# Altium project Ezlo_Voice_AssistantHUB.PrjPcb (part 6 of 10)

## Sheet Internal_Power_Sheet.SchDoc
size A4; DocumentNumber: 7; SheetNumber: 7; SheetTotal: 27
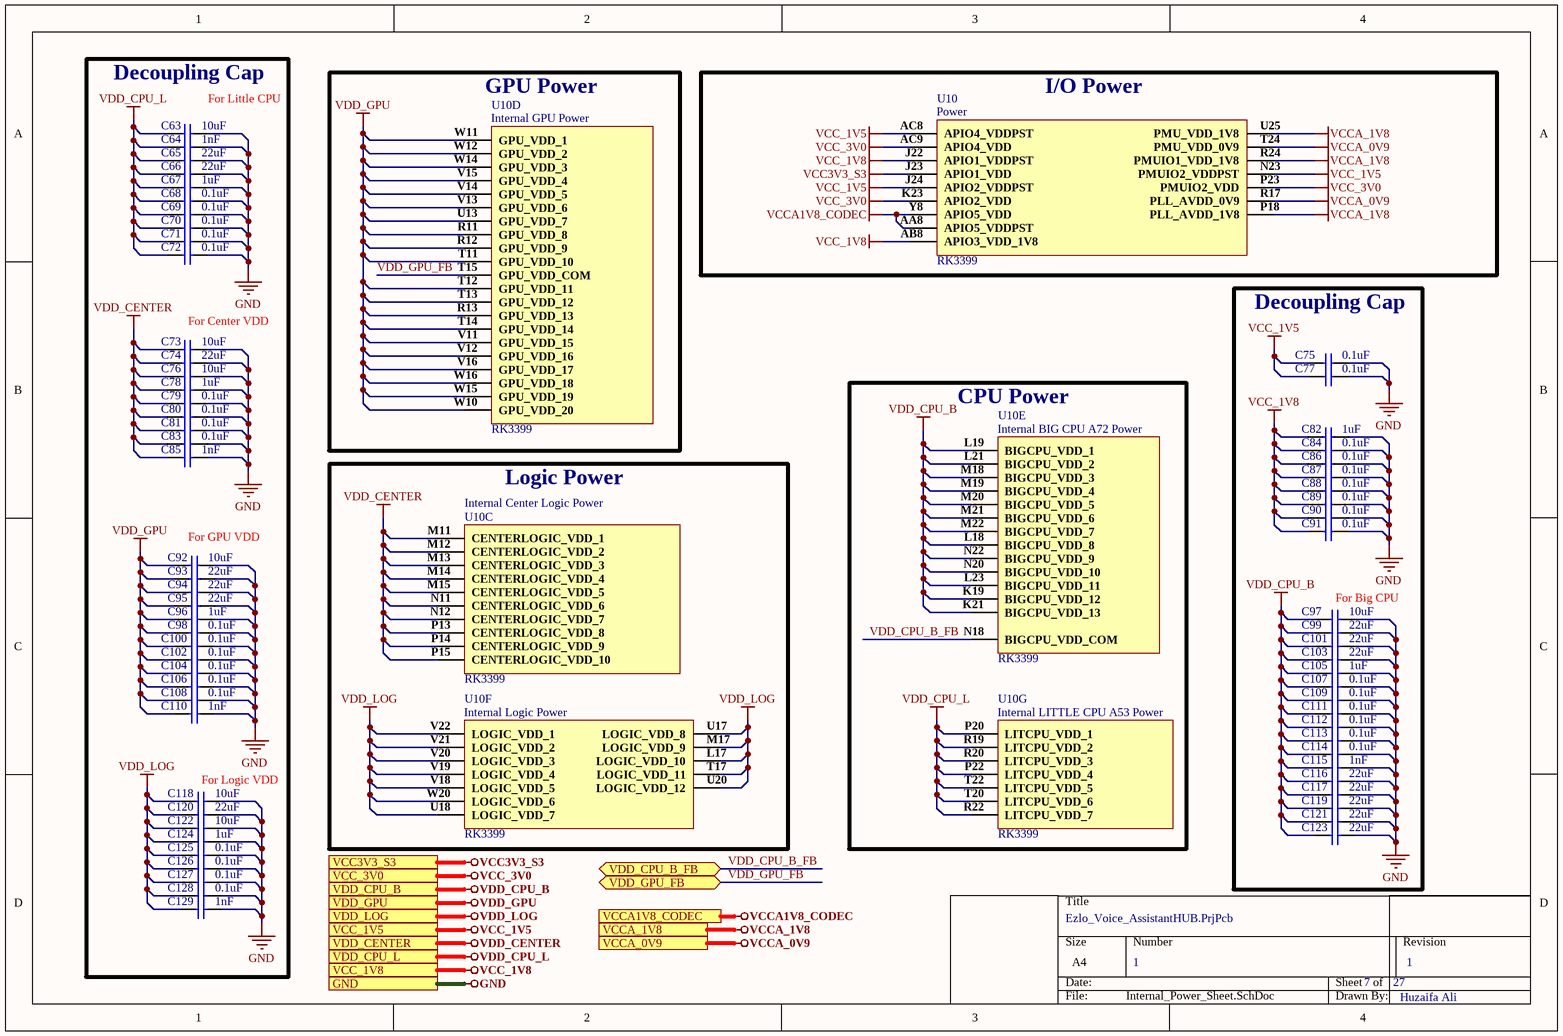
[diagram p9: Internal_Power_Sheet.SchDoc]

### Parts
C63  10uF  [Cap0603]
C64  1nF  [Cap0603]
C65  22uF  [Cap0805]
C66  22uF  [Cap0805]
C67  1uF  [Cap0402]
C68  0.1uF  [Cap0402]
C69  0.1uF  [Cap0402]
C70  0.1uF  [Cap0402]
C71  0.1uF  [Cap0402]
C72  0.1uF  [Cap0402]
C73  10uF  [Cap0603]
C74  22uF  [Cap0805]
C75  0.1uF  [Cap0402]
C76  10uF  [Cap0603]
C77  0.1uF  [Cap0402]
C78  1uF  [Cap0402]
C79  0.1uF  [Cap0402]
C80  0.1uF  [Cap0402]
C81  0.1uF  [Cap0402]
C82  1uF  [Cap0402]
C83  0.1uF  [Cap0402]
C84  0.1uF  [Cap0402]
C85  1nF  [Cap0603]
C86  0.1uF  [Cap0402]
C87  0.1uF  [Cap0402]
C88  0.1uF  [Cap0402]
C89  0.1uF  [Cap0402]
C90  0.1uF  [Cap0402]
C91  0.1uF  [Cap0402]
C92  10uF  [Cap0603]
C93  22uF  [Cap0805]
C94  22uF  [Cap0805]
C95  22uF  [Cap0805]
C96  1uF  [Cap0402]
C97  10uF  [Cap0603]
C98  0.1uF  [Cap0402]
C99  22uF  [Cap0805]
C100  0.1uF  [Cap0402]
C101  22uF  [Cap0805]
C102  0.1uF  [Cap0402]
C103  22uF  [Cap0805]
C104  0.1uF  [Cap0402]
C105  1uF  [Cap0402]
C106  0.1uF  [Cap0402]
C107  0.1uF  [Cap0402]
C108  0.1uF  [Cap0402]
C109  0.1uF  [Cap0402]
C110  1nF  [Cap0603]
C111  0.1uF  [Cap0402]
C112  0.1uF  [Cap 0402]
C113  0.1uF  [Cap0402]
C114  0.1uF  [Cap0402]
C115  1nF  [Cap0603]
C116  22uF  [Cap0805]
C117  22uF  [Cap0805]
C118  10uF  [Cap0603]
C119  22uF  [Cap0805]
C120  22uF  [Cap0805]
C121  22uF  [Cap0805]
C122  10uF  [Cap0603]
C123  22uF  [Cap0805]
C124  1uF  [Cap0402]
C125  0.1uF  [Cap0402]
C126  0.1uF  [Cap0402]
C127  0.1uF  [Cap0402]
C128  0.1uF  [Cap0402]
C129  1nF  [Cap0603]
U10  RK3399  [RK3399]  (parts C,D,E,F,G,29 of 34)

### Blocks framed on the sheet
Decoupling Cap: C63-C74 C76 C78-C81 C83 C85 C92-C96 C98 C100 C102 C104 C106 C108 C110 C118 C120 C122 C124-C129
GPU Power: U10
I/O Power: U10
Decoupling Cap: C75 C77 C82 C84 C86-C91 C97 C99 C101 C103 C105 C107 C109 C111-C117 C119 C121 C123
CPU Power: U10
Logic Power: U10

### Ports
GND, VCC3V3_S3, VCC_1V5, VCC_1V8, VCC_3V0, VCCA1V8_CODEC, VCCA_0V9, VCCA_1V8, VDD_CENTER, VDD_CPU_B, VDD_CPU_B_FB (bidir), VDD_CPU_L, VDD_GPU, VDD_GPU_FB (bidir), VDD_LOG

### Nets
GND: C63.2 C64.2 C65.2 C66.2 C67.2 C68.2 C69.2 C70.2 C71.2 C72.2 C73.2 C74.2 C75.2 C76.2 C77.2 C78.2 C79.2 C80.2 C81.2 C82.2 C83.2 C84.2 C85.2 C86.2 C87.2 C88.2 C89.2 C90.2 C91.2 C92.2 C93.2 C94.2 C95.2 C96.2 C97.2 C98.2 C99.2 C100.2 C101.2 C102.2 C103.2 C104.2 C105.2 C106.2 C107.2 C108.2 C109.2 C110.2 C111.2 C112.2 C113.2 C114.2 C115.2 C116.2 C117.2 C118.2 C119.2 C120.2 C121.2 C122.2 C123.2 C124.2 C125.2 C126.2 C127.2 C128.2 C129.2 ; port GND
VCC3V3_S3: U10.J23(APIO1_VDD) ; port VCC3V3_S3
VCC_1V5: C75.1 C77.1 U10.AC8(APIO4_VDDPST) U10.J24(APIO2_VDDPST) U10.N23(PMUIO2_VDDPST) ; port VCC_1V5
VCC_1V8: C82.1 C84.1 C86.1 C87.1 C88.1 C89.1 C90.1 C91.1 U10.AB8(APIO3_VDD_1V8) U10.J22(APIO1_VDDPST) ; port VCC_1V8
VCC_3V0: U10.AC9(APIO4_VDD) U10.K23(APIO2_VDD) U10.P23(PMUIO2_VDD) ; port VCC_3V0
VCCA1V8_CODEC: U10.AA8(APIO5_VDDPST) U10.Y8(APIO5_VDD) ; port VCCA1V8_CODEC
VCCA_0V9: U10.R17(PLL_AVDD_0V9) U10.T24(PMU_VDD_0V9) ; port VCCA_0V9
VCCA_1V8: U10.P18(PLL_AVDD_1V8) U10.R24(PMUIO1_VDD_1V8) U10.U25(PMU_VDD_1V8) ; port VCCA_1V8
VDD_CENTER: C73.1 C74.1 C76.1 C78.1 C79.1 C80.1 C81.1 C83.1 C85.1 U10.M11(CENTERLOGIC_VDD_1) U10.M12(CENTERLOGIC_VDD_2) U10.M13(CENTERLOGIC_VDD_3) U10.M14(CENTERLOGIC_VDD_4) U10.M15(CENTERLOGIC_VDD_5) U10.N11(CENTERLOGIC_VDD_6) U10.N12(CENTERLOGIC_VDD_7) U10.P13(CENTERLOGIC_VDD_8) U10.P14(CENTERLOGIC_VDD_9) U10.P15(CENTERLOGIC_VDD_10) ; port VDD_CENTER
VDD_CPU_B: C97.1 C99.1 C101.1 C103.1 C105.1 C107.1 C109.1 C111.1 C112.1 C113.1 C114.1 C115.1 C116.1 C117.1 C119.1 C121.1 C123.1 U10.K19(BIGCPU_VDD_12) U10.K21(BIGCPU_VDD_13) U10.L18(BIGCPU_VDD_8) U10.L19(BIGCPU_VDD_1) U10.L21(BIGCPU_VDD_2) U10.L23(BIGCPU_VDD_11) U10.M18(BIGCPU_VDD_3) U10.M19(BIGCPU_VDD_4) U10.M20(BIGCPU_VDD_5) U10.M21(BIGCPU_VDD_6) U10.M22(BIGCPU_VDD_7) U10.N20(BIGCPU_VDD_10) U10.N22(BIGCPU_VDD_9) ; port VDD_CPU_B
VDD_CPU_L: C63.1 C64.1 C65.1 C66.1 C67.1 C68.1 C69.1 C70.1 C71.1 C72.1 U10.P20(LITCPU_VDD_1) U10.P22(LITCPU_VDD_4) U10.R19(LITCPU_VDD_2) U10.R20(LITCPU_VDD_3) U10.R22(LITCPU_VDD_7) U10.T20(LITCPU_VDD_6) U10.T22(LITCPU_VDD_5) ; port VDD_CPU_L
VDD_GPU: C92.1 C93.1 C94.1 C95.1 C96.1 C98.1 C100.1 C102.1 C104.1 C106.1 C108.1 C110.1 U10.R11(GPU_VDD_8) U10.R12(GPU_VDD_9) U10.R13(GPU_VDD_13) U10.T11(GPU_VDD_10) U10.T12(GPU_VDD_11) U10.T13(GPU_VDD_12) U10.T14(GPU_VDD_14) U10.U13(GPU_VDD_7) U10.V11(GPU_VDD_15) U10.V12(GPU_VDD_16) U10.V13(GPU_VDD_6) U10.V14(GPU_VDD_5) U10.V15(GPU_VDD_4) U10.V16(GPU_VDD_17) U10.W10(GPU_VDD_20) U10.W11(GPU_VDD_1) U10.W12(GPU_VDD_2) U10.W14(GPU_VDD_3) U10.W15(GPU_VDD_19) U10.W16(GPU_VDD_18) ; port VDD_GPU
VDD_LOG: C118.1 C120.1 C122.1 C124.1 C125.1 C126.1 C127.1 C128.1 C129.1 U10.L17(LOGIC_VDD_10) U10.M17(LOGIC_VDD_9) U10.T17(LOGIC_VDD_11) U10.U17(LOGIC_VDD_8) U10.U18(LOGIC_VDD_7) U10.U20(LOGIC_VDD_12) U10.V18(LOGIC_VDD_5) U10.V19(LOGIC_VDD_4) U10.V20(LOGIC_VDD_3) U10.V21(LOGIC_VDD_2) U10.V22(LOGIC_VDD_1) U10.W20(LOGIC_VDD_6) ; port VDD_LOG
VDD_CPU_B_FB: U10.N18(BIGCPU_VDD_COM) ; port VDD_CPU_B_FB
VDD_GPU_FB: U10.T15(GPU_VDD_COM) ; port VDD_GPU_FB

### Notes on the sheet
- For Little CPU
- Text
- For Center VDD
- For GPU VDD
- (near C97) For Big CPU
- (near C118) For Logic VDD
- 1
- Huzaifa Ali
- (in symbol RK3399, part C) Internal Center Logic Power
- (in symbol RK3399, part D) Internal GPU Power
- (in symbol RK3399, part E) Internal BIG CPU A72 Power
- (in symbol RK3399, part F) Internal Logic Power
- (in symbol RK3399, part G) Internal LITTLE CPU A53 Power
- (in symbol RK3399, part 29) Power

### Library data of the parts
C63 C73 C76 C92 C97 C118 C122 = C1608X5R1E106M080AC: CAP CER 10UF 25V X5R 0603; Manufacturer: TDK; Dielectric Material: Ceramic; Tolerance: 20%; Supplier 1: Digi-Key; Manufacturer Part Number: C1608X5R1E106M080AC; Stock 1: 61681; Pricing 1: 1=0.96, 10=0.704, 100=0.483, 500=0.38238, 1000=0.322 (USD); Mount: Surface Mount; Case/Package: 0603; Weight: 7.1E-05oz; Case Code (Imperial): 0603; Case Code (Metric): 1608; Min Operating Temperature: -55°C; Max Operating Temperature: 85°C; Capacitance: 10uF; Packaging: Tape and Reel; Voltage Rating: 25V; Voltage Rating (DC): 25V; Termination: SMD/SMT; Package Quantity: 1; Dielectric: X5R; Composition: Ceramic; Length: 1.6mm; Height: 0.8mm; Width: 0.8mm; Thickness: 0.039inch; Depth: 0.8mm; Lead Free: Lead Free; REACH SVHC: No SVHC; Supplier Part Number 1: 445-9015-1-ND
C64 C85 C110 C115 C129 = CC0603KRX7R8BB102: CAP CER 0603 1nF 25 V ±10 % Tolerance X7R SMT; Manufacturer: Yageo; Tolerance: 10%; Voltage Rating: 25V; Supplier 1: Arrow Electronics; Manufacturer Part Number: CC0603KRX7R8BB102; RoHS: Yes; Category: Ceramic Capacitors; Stock 1: 974; Pricing 1: 1=0.07500, 10=0.04120, 25=0.04030, 100=0.02020, 250=0.02000, 500=0.01320 (USD); Mount: Surface Mount; Case/Package: 0603; Case Code (Imperial): 0603; Case Code (Metric): 1608; Weight: 7.1E-05oz; Min Operating Temperature: -55°C; Max Operating Temperature: 125°C; Capacitance: 1nF; Dielectric: X7R; Packaging: Tape and Reel; Voltage Rating (DC): 25V; Termination: SMD/SMT; Resistor Type: Ceramic; Series: CC; Construction: Flat; Length: 1.6mm; Width: 0.031inch; Height: 0.8mm; Thickness: 0.035inch; Depth: 0.8mm; Radiation Hardening: No; Lead Free: Lead Free; Halogen Free: Halogen Free; RoHS Compliant: Yes; ComponentLink1URL: https://datasheet.ciiva.com/13263/upy-gphc-x7r-6-3v-to-50v-8-12304-13263372.pdf?src-supplier=Mouser; ComponentLink1Description: https://datasheet.ciiva.com/13263/upy-gphc-x7r-6-3v-to-50v-8-12304-13263372.pdf?src-supplier=Mouser; Supplier Part Number 1: CC0603KRX7R8BB102
C65 C66 C74 C93-C95 C99 C101 C103 C116 C117 C119-C121 C123 = CL21A226MAYNNNE: 0803 22uF 25V X5R 20% multilayer ceramic capacitor; Manufacturer: Samsung; Supplier 1: Digi-Key; Manufacturer Part Number: CL21A226MAYNNNE; RoHS: Yes; Category: Ceramic Capacitors; Stock 1: 442950; Pricing 1: 2000=0.07687, 4000=0.07110, 10000=0.06726, 14000=0.06380, 50000=0.05765 (USD); RoHS Compliant: Yes; Supplier Part Number 1: 1276-CL21A226MAYNNNETR-ND
C67 C78 C82 C96 C105 C124 = GRM155R61E105KA12D: CAP CER 1UF 25V X5R 0402; Manufacturer: Murata; Material: Ceramic; Tolerance: 10%; Supplier 1: Digi-Key; Manufacturer Part Number: GRM155R61E105KA12D; Stock 1: 1194305; Pricing 1: 1=0.11, 10=0.077, 100=0.0363, 500=0.02546, 1000=0.02108, 2500=0.01962, 5000=0.01795 (USD); Mount: Surface Mount; Case/Package: 0402; Weight: 0.000212oz; Case Code (Metric): 1005; Case Code (Imperial): 0402; Min Operating Temperature: -55°C; Max Operating Temperature: 85°C; Capacitance: 1uF; Voltage Rating: 25V; Packaging: Tape and Reel; Dielectric: X5R; Voltage: 25V; Termination: SMD/SMT; Voltage Rating (DC): 25V; Package Quantity: 10000; Length: 1mm; Height: 0.5mm; Width: 0.5mm; Thickness: 0.022inch; Depth: 0.5mm; REACH SVHC: No SVHC; Lead Free: Lead Free; ComponentLink1URL: http://www.farnell.com/datasheets/2048341.pdf?src-supplier=Element14; ComponentLink1Description: http://www.farnell.com/datasheets/2048341.pdf?src-supplier=Element14; Supplier Part Number 1: 490-10017-1-ND
C68-C72 C75 C77 C79-C81 C83 C84 C86-C91 C98 C100 C102 C104 C106-C109 C111 C113 C114 C125-C128 = CC0402KRX5R6BB104: CAP CER 0.1UF 10V X5R 0402; Manufacturer: Yageo; Capacitance: 100nF; Tolerance: 10%; Dissipation Factor: 5%; Insulation Resistance: 10GR; Supplier 1: Digi-Key; Manufacturer Part Number: CC0402KRX5R6BB104; RoHS: Yes; Category: Ceramic Capacitors; Stock 1: 6385580; Pricing 1: 1=0.10000, 10=0.02700, 50=0.01500, 100=0.01220, 500=0.00874, 1000=0.00687, 2500=0.00625, 5000=0.00575 (USD); Mount: Surface Mount; Case/Package: 0402; Number of Pins: 2; Case Code (Imperial): 0402; Case Code (Metric): 1005; Min Operating Temperature: -55°C; Max Operating Temperature: 85°C; Dielectric: X5R; Packaging: Tape and Reel; Voltage Rating: 10V; Package Quantity: 1; Termination: SMD/SMT; Voltage Rating (DC): 10V; Series: CC; Length: 1mm; Width: 0.02inch; Height: 0.5mm; Depth: 0.5mm; Thickness: 0.022inch; Radiation Hardening: No; RoHS Compliant: Yes; REACH SVHC: No SVHC; Lead Free: Lead Free; Halogen Free: Halogen Free; ComponentLink1URL: https://datasheet.ciiva.com/144/mlccorderingcode-144029.pdf?src-supplier=Digi-Key; ComponentLink1Description: https://datasheet.ciiva.com/144/mlccorderingcode-144029.pdf?src-supplier=Digi-Key; ComponentLink2URL: https://datasheet.ciiva.com/144/mlccorderingcode-144028.pdf?src-supplier=Digi-Key; ComponentLink2Description: https://datasheet.ciiva.com/144/mlccorderingcode-144028.pdf?src-supplier=Digi-Key; ComponentLink3URL: https://datasheet.ciiva.com/144/mlccorderingcode-144030.pdf?src-supplier=Digi-Key; ComponentLink3Description: https://datasheet.ciiva.com/144/mlccorderingcode-144030.pdf?src-supplier=Digi-Key; ComponentLink4URL: https://datasheet.ciiva.com/7978/1359354-7978091.pdf?src-supplier=Element14; ComponentLink4Description: https://datasheet.ciiva.com/7978/1359354-7978091.pdf?src-supplier=Element14; ComponentLink5URL: https://datasheet.ciiva.com/11587/upy-gphc-x5r-4v-to-50v-12-11587302.pdf?src-supplier=Avnet; ComponentLink5Description: https://datasheet.ciiva.com/11587/upy-gphc-x5r-4v-to-50v-12-11587302.pdf?src-supplier=Avnet; Supplier Part Number 1: 311-1336-1-ND
C112 = GRM155R71H104ME14D: CAP CER 0.1UF 50V X7R 0402; Manufacturer: Murata; Tolerance: 20%; Capacitance: 100nF; Supplier 1: Digi-Key; Manufacturer Part Number: GRM155R71H104ME14D; Stock 1: 439844; Pricing 1: 1=0.1, 10=0.038, 100=0.0168, 500=0.01198, 1000=0.00941, 2500=0.00855, 5000=0.00787 (USD); Mount: Surface Mount; Case/Package: 0402; Min Operating Temperature: -55°C; Max Operating Temperature: 125°C; Packaging: Cut Tape; Voltage Rating: 50V; Length: 0.039inch; Width: 0.02inch; Thickness: 0.022inch; ComponentLink1URL: http://search.murata.co.jp/Ceramy/image/img/A01X/G101/ENG/GRM155R71H104ME14-01.pdf?src-supplier=Digi-Key; ComponentLink1Description: http://search.murata.co.jp/Ceramy/image/img/A01X/G101/ENG/GRM155R71H104ME14-01.pdf?src-supplier=Digi-Key; ComponentLink2URL: http://psearch.en.murata.com/capacitor/product/GRM155R71H104ME14%23.pdf?src-supplier=Avnet; ComponentLink2Description: http://psearch.en.murata.com/capacitor/product/GRM155R71H104ME14%23.pdf?src-supplier=Avnet; ComponentLink3URL: http://components.arrow.com/part/dataview/0323_07177683?src-supplier=Arrow+Europe; ComponentLink3Description: http://components.arrow.com/part/dataview/0323_07177683?src-supplier=Arrow+Europe; ComponentLink4URL: http://www.mouser.com/ds/2/281/c02e-2905.pdf?src-supplier=Mouser; ComponentLink4Description: http://www.mouser.com/ds/2/281/c02e-2905.pdf?src-supplier=Mouser; Supplier Part Number 1: 490-10701-1-ND
U10 = RK3399: RK3399 CPU BGA for HD set-top box chip BGA Chipse; Manufacturer: Fuzhou Rockchip Electronics; ComponentLink1Description: Aliexpress; ComponentLink1URL: https://www.aliexpress.com/item/1005001971093459.html?spm=a2g0n.productlist.0.0.3c7csv8Qsv8Quh&browser_id=3ac7e9efb8074641aaabc4d871f09748&aff_trace_key=&aff_platform=msite&m_page_id=181389a08711fc2600d8cc522bab8d702dd4189be0&gclid=&pdp_npi=2%40dis%21USD%21%2123.6%21%21%21%21%21%402101d91e16545120399167831e8b89%21%21sea&algo_pvid=4303aedd-774c-4013-953d-920f10b55003; Manufacturer Part Number: RK3399; Footprint: FCBGA828

## Sheet GND_Sheet.SchDoc
size A4; DocumentNumber: 8; SheetNumber: 8; SheetTotal: 27
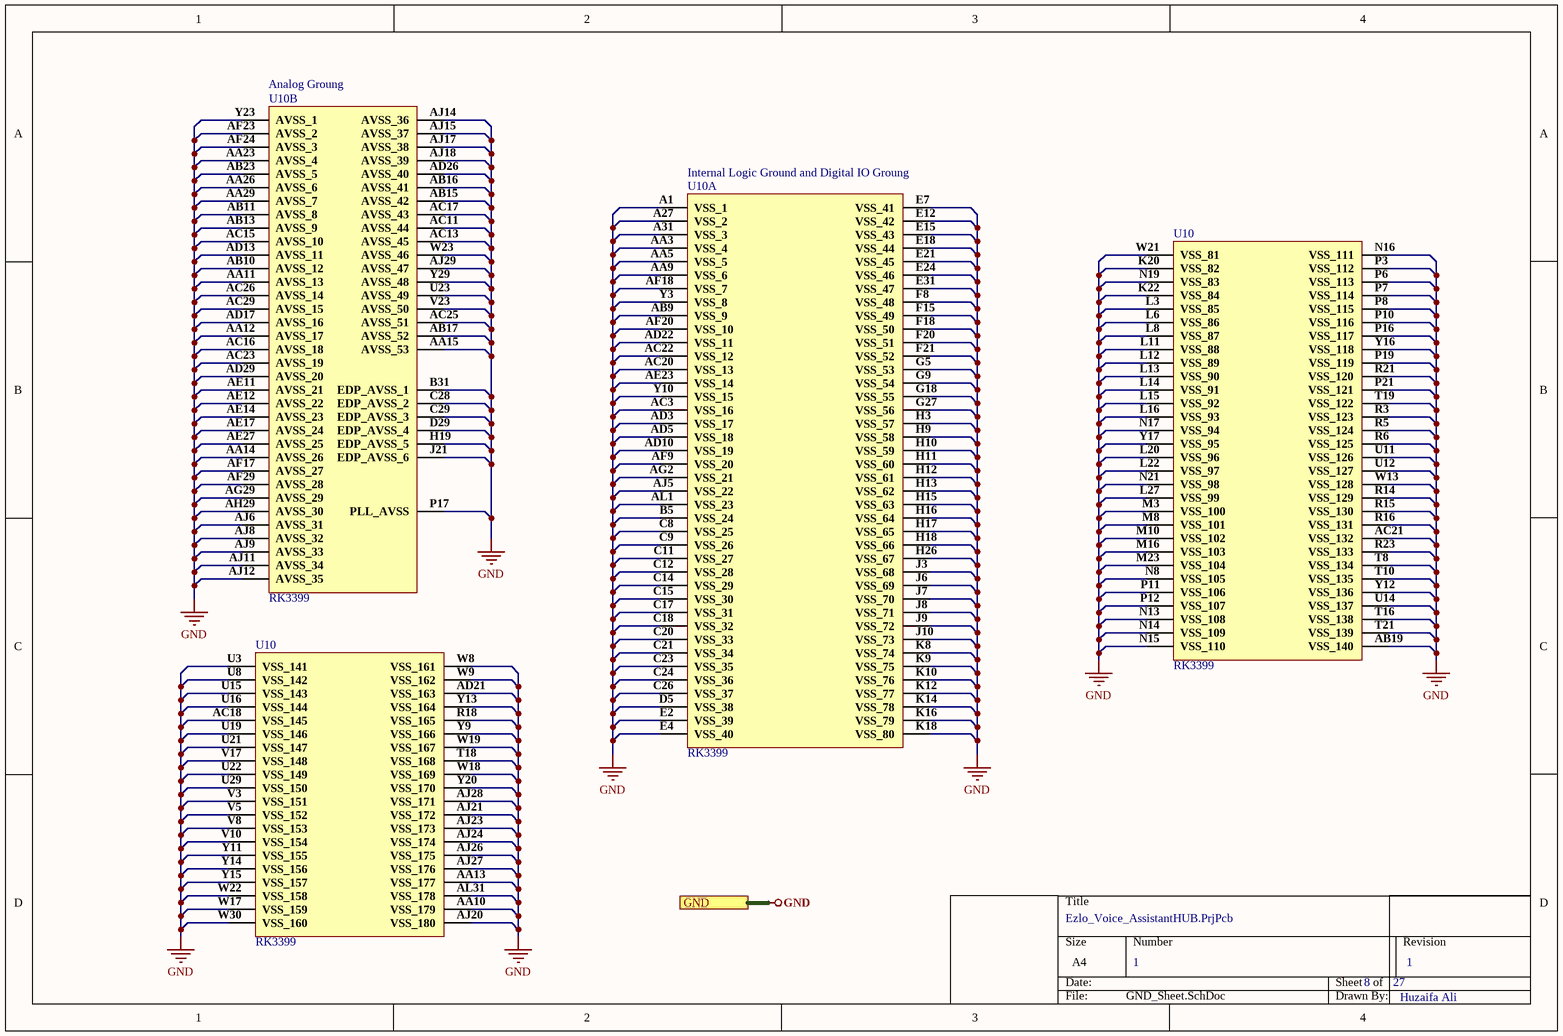
[diagram p10: GND_Sheet.SchDoc]

### Parts
U10  RK3399  [RK3399]  (parts A,B,33,34 of 34)

### Ports
GND

### Nets
GND: U10.A1(VSS_1) U10.A27(VSS_2) U10.A31(VSS_3) U10.AA3(VSS_4) U10.AA5(VSS_5) U10.AA9(VSS_6) U10.AA10(VSS_179) U10.AA11(AVSS_13) U10.AA12(AVSS_17) U10.AA13(VSS_177) U10.AA14(AVSS_26) U10.AA15(AVSS_53) U10.AA23(AVSS_4) U10.AA26(AVSS_6) U10.AA29(AVSS_7) U10.AB9(VSS_9) U10.AB10(AVSS_12) U10.AB11(AVSS_8) U10.AB13(AVSS_9) U10.AB15(AVSS_42) U10.AB16(AVSS_41) U10.AB17(AVSS_52) U10.AB19(VSS_140) U10.AB23(AVSS_5) U10.AC3(VSS_16) U10.AC11(AVSS_44) U10.AC13(AVSS_45) U10.AC15(AVSS_10) U10.AC16(AVSS_18) U10.AC17(AVSS_43) U10.AC18(VSS_145) U10.AC20(VSS_13) U10.AC21(VSS_132) U10.AC22(VSS_12) U10.AC23(AVSS_19) U10.AC25(AVSS_51) U10.AC26(AVSS_14) U10.AC29(AVSS_15) U10.AD3(VSS_17) U10.AD5(VSS_18) U10.AD10(VSS_19) U10.AD13(AVSS_11) U10.AD17(AVSS_16) U10.AD21(VSS_163) U10.AD22(VSS_11) U10.AD26(AVSS_40) U10.AD29(AVSS_20) U10.AE11(AVSS_21) U10.AE12(AVSS_22) U10.AE14(AVSS_23) U10.AE17(AVSS_24) U10.AE23(VSS_14) U10.AE27(AVSS_25) U10.AF9(VSS_20) U10.AF17(AVSS_27) U10.AF18(VSS_7) U10.AF20(VSS_10) U10.AF23(AVSS_2) U10.AF24(AVSS_3) U10.AF29(AVSS_28) U10.AG2(VSS_21) U10.AG29(AVSS_29) U10.AH29(AVSS_30) U10.AJ5(VSS_22) U10.AJ6(AVSS_31) U10.AJ8(AVSS_32) U10.AJ9(AVSS_33) U10.AJ11(AVSS_34) U10.AJ12(AVSS_35) U10.AJ14(AVSS_36) U10.AJ15(AVSS_37) U10.AJ17(AVSS_38) U10.AJ18(AVSS_39) U10.AJ20(VSS_180) U10.AJ21(VSS_172) U10.AJ23(VSS_173) U10.AJ24(VSS_174) U10.AJ26(VSS_175) U10.AJ27(VSS_176) U10.AJ28(VSS_171) U10.AJ29(AVSS_47) U10.AL1(VSS_23) U10.AL31(VSS_178) U10.B5(VSS_24) U10.B31(EDP_AVSS_1) U10.C8(VSS_25) U10.C9(VSS_26) U10.C11(VSS_27) U10.C12(VSS_28) U10.C14(VSS_29) U10.C15(VSS_30) U10.C17(VSS_31) U10.C18(VSS_32) U10.C20(VSS_33) U10.C21(VSS_34) U10.C23(VSS_35) U10.C24(VSS_36) U10.C26(VSS_37) U10.C28(EDP_AVSS_2) U10.C29(EDP_AVSS_3) U10.D5(VSS_38) U10.D29(EDP_AVSS_4) U10.E2(VSS_39) U10.E4(VSS_40) U10.E7(VSS_41) U10.E12(VSS_42) U10.E15(VSS_43) U10.E18(VSS_44) U10.E21(VSS_45) U10.E24(VSS_46) U10.E31(VSS_47) U10.F8(VSS_48) U10.F15(VSS_49) U10.F18(VSS_50) U10.F20(VSS_51) U10.F21(VSS_52) U10.G5(VSS_53) U10.G9(VSS_54) U10.G18(VSS_55) U10.G27(VSS_56) U10.H3(VSS_57) U10.H9(VSS_58) U10.H10(VSS_59) U10.H11(VSS_60) U10.H12(VSS_61) U10.H13(VSS_62) U10.H15(VSS_63) U10.H16(VSS_64) U10.H17(VSS_65) U10.H18(VSS_66) U10.H19(EDP_AVSS_5) U10.H26(VSS_67) U10.J3(VSS_68) U10.J6(VSS_69) U10.J7(VSS_70) U10.J8(VSS_71) U10.J9(VSS_72) U10.J10(VSS_73) U10.J21(EDP_AVSS_6) U10.K8(VSS_74) U10.K9(VSS_75) U10.K10(VSS_76) U10.K12(VSS_77) U10.K14(VSS_78) U10.K16(VSS_79) U10.K18(VSS_80) U10.K20(VSS_82) U10.K22(VSS_84) U10.L3(VSS_85) U10.L6(VSS_86) U10.L8(VSS_87) U10.L11(VSS_88) U10.L12(VSS_89) U10.L13(VSS_90) U10.L14(VSS_91) U10.L15(VSS_92) U10.L16(VSS_93) U10.L20(VSS_96) U10.L22(VSS_97) U10.L27(VSS_99) U10.M3(VSS_100) U10.M8(VSS_101) U10.M10(VSS_102) U10.M16(VSS_103) U10.M23(VSS_104) U10.N8(VSS_105) U10.N13(VSS_108) U10.N14(VSS_109) U10.N15(VSS_110) U10.N16(VSS_111) U10.N17(VSS_94) U10.N19(VSS_83) U10.N21(VSS_98) U10.P3(VSS_112) U10.P6(VSS_113) U10.P7(VSS_114) U10.P8(VSS_115) U10.P10(VSS_116) U10.P11(VSS_106) U10.P12(VSS_107) U10.P16(VSS_117) U10.P17(PLL_AVSS) U10.P19(VSS_119) U10.P21(VSS_121) U10.R3(VSS_123) U10.R5(VSS_124) U10.R6(VSS_125) U10.R14(VSS_129) U10.R15(VSS_130) U10.R16(VSS_131) U10.R18(VSS_165) U10.R21(VSS_120) U10.R23(VSS_133) U10.T8(VSS_134) U10.T10(VSS_135) U10.T16(VSS_138) U10.T18(VSS_168) U10.T19(VSS_122) U10.T21(VSS_139) U10.U3(VSS_141) U10.U8(VSS_142) U10.U11(VSS_126) U10.U12(VSS_127) U10.U14(VSS_137) U10.U15(VSS_143) U10.U16(VSS_144) U10.U19(VSS_146) U10.U21(VSS_147) U10.U22(VSS_149) U10.U23(AVSS_49) U10.U29(VSS_150) U10.V3(VSS_151) U10.V5(VSS_152) U10.V8(VSS_153) U10.V10(VSS_154) U10.V17(VSS_148) U10.V23(AVSS_50) U10.W8(VSS_161) U10.W9(VSS_162) U10.W13(VSS_128) U10.W17(VSS_159) U10.W18(VSS_169) U10.W19(VSS_167) U10.W21(VSS_81) U10.W22(VSS_158) U10.W23(AVSS_46) U10.W30(VSS_160) U10.Y3(VSS_8) U10.Y9(VSS_166) U10.Y10(VSS_15) U10.Y11(VSS_155) U10.Y12(VSS_136) U10.Y13(VSS_164) U10.Y14(VSS_156) U10.Y15(VSS_157) U10.Y16(VSS_118) U10.Y17(VSS_95) U10.Y20(VSS_170) U10.Y23(AVSS_1) U10.Y29(AVSS_48) ; port GND

### Notes on the sheet
- 1
- Huzaifa Ali
- (in symbol RK3399, part A) Internal Logic Ground and Digital IO Groung
- (in symbol RK3399, part B) Analog Groung

### Library data of the parts
U10 = RK3399: as U10 on sheet Internal_Power_Sheet; ComponentLink1Description: Aliexpress; ComponentLink1URL: https://www.aliexpress.com/item/1005001971093459.html?spm=a2g0n.productlist.0.0.3c7csv8Qsv8Quh&browser_id=3ac7e9efb8074641aaabc4d871f09748&aff_trace_key=&aff_platform=msite&m_page_id=181389a08711fc2600d8cc522bab8d702dd4189be0&gclid=&pdp_npi=2%40dis%21USD%21%2123.6%21%21%21%21%21%402101d91e16545120399167831e8b89%21%21sea&algo_pvid=4303aedd-774c-4013-953d-920f10b55003; Manufacturer Part Number: RK3399; Footprint: FCBGA828

## Sheet CameraOrDisplay_Sheet.SchDoc
size A4; DocumentNumber: 11; SheetNumber: 11; SheetTotal: 27
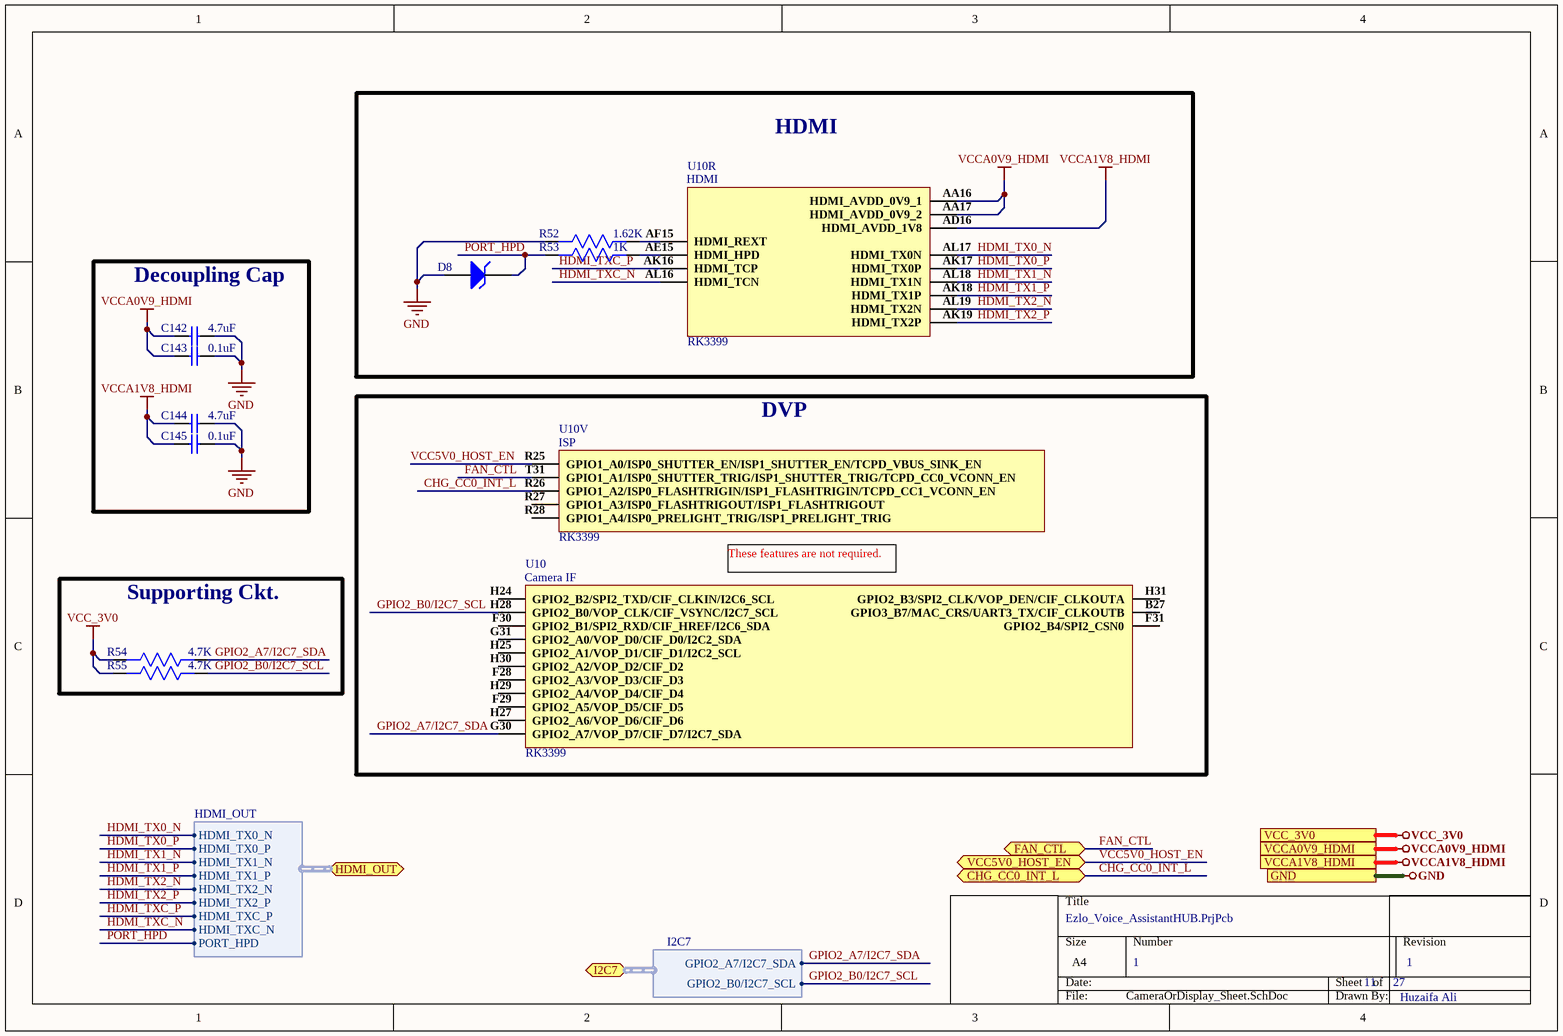
[diagram p11: CameraOrDisplay_Sheet.SchDoc]

### Parts
C142  4.7uF  [Cap0603]
C143  0.1uF  [Cap0402]
C144  4.7uF  [Cap0603]
C145  0.1uF  [Cap0402]
D8  BZT52C3V3-E3-08  [SOD-123]  (value not drawn)
R52  1.62K  [Res0603]
R53  1K  [Res0603]
R54  4.7K  [Res0603]
R55  4.7K  [Res0603]
U10  RK3399  [RK3399]  (parts R,V,28 of 34)

### Blocks framed on the sheet
HDMI: D8 R52 R53 U10
Decoupling Cap: C142-C145
DVP: U10
Supporting Ckt.: R54 R55

### Ports
CHG_CC0_INT_L (bidir), FAN_CTL (bidir), GND, HDMI_OUT (bidir, harness HDMI_OUT), I2C7 (bidir, harness I2C7), VCC5V0_HOST_EN (bidir), VCC_3V0, VCCA0V9_HDMI, VCCA1V8_HDMI

### Harnesses
HDMI_OUT: HDMI_TX0_N, HDMI_TX0_P, HDMI_TXC_P, HDMI_TXC_N, HDMI_TX1_N, HDMI_TX1_P, HDMI_TX2_N, HDMI_TX2_P, PORT_HPD
I2C7: GPIO2_B0/I2C7_SCL, GPIO2_A7/I2C7_SDA

### Nets
GND: C142.2 C143.2 C144.2 C145.2 D8.1(A) R52.2 ; port GND
VCC_3V0: R54.2 R55.2 ; port VCC_3V0
VCCA0V9_HDMI: C142.1 C143.1 U10.AA16(HDMI_AVDD_0V9_1) U10.AA17(HDMI_AVDD_0V9_2) ; port VCCA0V9_HDMI
VCCA1V8_HDMI: C144.1 C145.1 U10.AD16(HDMI_AVDD_1V8) ; port VCCA1V8_HDMI
CHG_CC0_INT_L: U10.R26(GPIO1_A2/ISP0_FLASHTRIGIN/ISP1_FLASHTRIGIN/TCPD_CC1_VCONN_EN) ; port CHG_CC0_INT_L
FAN_CTL: U10.T31(GPIO1_A1/ISP0_SHUTTER_TRIG/ISP1_SHUTTER_TRIG/TCPD_CC0_VCONN_EN) ; port FAN_CTL
GPIO2_A7/I2C7_SDA: R54.1 U10.G30(GPIO2_A7/VOP_D7/CIF_D7/I2C7_SDA) ; port I2C7.GPIO2_A7/I2C7_SDA
GPIO2_B0/I2C7_SCL: R55.1 U10.H28(GPIO2_B0/VOP_CLK/CIF_VSYNC/I2C7_SCL) ; port I2C7.GPIO2_B0/I2C7_SCL
HDMI_TX0_N: U10.AL17(HDMI_TX0N) ; port HDMI_OUT.HDMI_TX0_N  [project net HDMI_OUT.HDMI_TX0_N]
HDMI_TX0_P: U10.AK17(HDMI_TX0P) ; port HDMI_OUT.HDMI_TX0_P  [project net HDMI_OUT.HDMI_TX0_P]
HDMI_TX1_N: U10.AL18(HDMI_TX1N) ; port HDMI_OUT.HDMI_TX1_N  [project net HDMI_OUT.HDMI_TX1_N]
HDMI_TX1_P: U10.AK18(HDMI_TX1P) ; port HDMI_OUT.HDMI_TX1_P  [project net HDMI_OUT.HDMI_TX1_P]
HDMI_TX2_N: U10.AL19(HDMI_TX2N) ; port HDMI_OUT.HDMI_TX2_N  [project net HDMI_OUT.HDMI_TX2_N]
HDMI_TX2_P: U10.AK19(HDMI_TX2P) ; port HDMI_OUT.HDMI_TX2_P  [project net HDMI_OUT.HDMI_TX2_P]
HDMI_TXC_N: U10.AL16(HDMI_TCN) ; port HDMI_OUT.HDMI_TXC_N  [project net HDMI_OUT.HDMI_TXC_N]
HDMI_TXC_P: U10.AK16(HDMI_TCP) ; port HDMI_OUT.HDMI_TXC_P  [project net HDMI_OUT.HDMI_TXC_P]
PORT_HPD: D8.2(K) R53.2 ; port HDMI_OUT.PORT_HPD  [project net HDMI_OUT.PORT_HPD]
VCC5V0_HOST_EN: U10.R25(GPIO1_A0/ISP0_SHUTTER_EN/ISP1_SHUTTER_EN/TCPD_VBUS_SINK_EN) ; port VCC5V0_HOST_EN
NetR52_1: R52.1 U10.AF15(HDMI_REXT)
NetR53_1: R53.1 U10.AE15(HDMI_HPD)

Not connected (* = marked no-connect by the designer): U10 B27(GPIO3_B7/MAC_CRS/UART3_TX/CIF_CLKOUTB) F28(GPIO2_A3/VOP_D3/CIF_D3) F29(GPIO2_A5/VOP_D5/CIF_D5) F30(GPIO2_B1/SPI2_RXD/CIF_HREF/I2C6_SDA) F31(GPIO2_B4/SPI2_CSN0) G31(GPIO2_A0/VOP_D0/CIF_D0/I2C2_SDA) H24(GPIO2_B2/SPI2_TXD/CIF_CLKIN/I2C6_SCL) H25(GPIO2_A1/VOP_D1/CIF_D1/I2C2_SCL) H27(GPIO2_A6/VOP_D6/CIF_D6) H29(GPIO2_A4/VOP_D4/CIF_D4) H30(GPIO2_A2/VOP_D2/CIF_D2) H31(GPIO2_B3/SPI2_CLK/VOP_DEN/CIF_CLKOUTA) R27(GPIO1_A3/ISP0_FLASHTRIGOUT/ISP1_FLASHTRIGOUT) R28(GPIO1_A4/ISP0_PRELIGHT_TRIG/ISP1_PRELIGHT_TRIG)

### Notes on the sheet
- (near U10) These features are not required.
- 1
- Huzaifa Ali
- (in symbol RK3399, part R) HDMI
- (in symbol RK3399, part V) ISP
- (in symbol RK3399, part 28) Camera IF

### Library data of the parts
C142 C144 = CL10A475KA8NQNC: CAP CER 4.7UF 25V X5R 0603; Manufacturer: Samsung; Tolerance: 10%; Supplier 1: Arrow Electronics; Manufacturer Part Number: CL10A475KA8NQNC; RoHS: Yes; Category: Ceramic Capacitors; Stock 1: 260000; Pricing 1: 4000=0.08490, 8000=0.05240, 16000=0.05180, 24000=0.05130, 40000=0.05070 (USD); Mount: Surface Mount; Case/Package: 0603; Case Code (Metric): 1608; Case Code (Imperial): 0603; Contact Plating: Tin; Min Operating Temperature: -55°C; Max Operating Temperature: 85°C; Package Quantity: 1; Packaging: Tape and Reel; Capacitance: 4.7uF; Voltage Rating: 25V; Dielectric: X5R; Series: CL; Termination: Wraparound; Construction: Flat; Length: 1.6mm; Width: 0.031inch; Thickness: 0.035inch; Depth: 0.8mm; Lead Free: Lead Free; RoHS Compliant: Yes; ComponentLink1URL: https://datasheet.ciiva.com/25787/cl10a475ka8nqnc-25787017.pdf?src-supplier=Digi-Key; ComponentLink1Description: https://datasheet.ciiva.com/25787/cl10a475ka8nqnc-25787017.pdf?src-supplier=Digi-Key; Supplier Part Number 1: CL10A475KA8NQNC
C143 C145 = CC0402KRX5R6BB104: as C68 on sheet Internal_Power_Sheet; Supplier 1: Digi-Key; Manufacturer Part Number: CC0402KRX5R6BB104; RoHS: Yes; Category: Ceramic Capacitors; Stock 1: 6385580; Pricing 1: 1=0.10000, 10=0.02700, 50=0.01500, 100=0.01220, 500=0.00874, 1000=0.00687, 2500=0.00625, 5000=0.00575 (USD); Mount: Surface Mount; Case/Package: 0402; Number of Pins: 2; Case Code (Imperial): 0402; Case Code (Metric): 1005; Min Operating Temperature: -55°C; Max Operating Temperature: 85°C; Dielectric: X5R; Packaging: Tape and Reel; Voltage Rating: 10V; Package Quantity: 1; Termination: SMD/SMT; Voltage Rating (DC): 10V; Series: CC; Length: 1mm; Width: 0.02inch; Height: 0.5mm; Depth: 0.5mm; Thickness: 0.022inch; Radiation Hardening: No; RoHS Compliant: Yes; REACH SVHC: No SVHC; Lead Free: Lead Free; Halogen Free: Halogen Free; ComponentLink1URL: https://datasheet.ciiva.com/144/mlccorderingcode-144029.pdf?src-supplier=Digi-Key; ComponentLink1Description: https://datasheet.ciiva.com/144/mlccorderingcode-144029.pdf?src-supplier=Digi-Key; ComponentLink2URL: https://datasheet.ciiva.com/144/mlccorderingcode-144028.pdf?src-supplier=Digi-Key; ComponentLink2Description: https://datasheet.ciiva.com/144/mlccorderingcode-144028.pdf?src-supplier=Digi-Key; ComponentLink3URL: https://datasheet.ciiva.com/144/mlccorderingcode-144030.pdf?src-supplier=Digi-Key; ComponentLink3Description: https://datasheet.ciiva.com/144/mlccorderingcode-144030.pdf?src-supplier=Digi-Key; ComponentLink4URL: https://datasheet.ciiva.com/7978/1359354-7978091.pdf?src-supplier=Element14; ComponentLink4Description: https://datasheet.ciiva.com/7978/1359354-7978091.pdf?src-supplier=Element14; ComponentLink5URL: https://datasheet.ciiva.com/11587/upy-gphc-x5r-4v-to-50v-12-11587302.pdf?src-supplier=Avnet; ComponentLink5Description: https://datasheet.ciiva.com/11587/upy-gphc-x5r-4v-to-50v-12-11587302.pdf?src-supplier=Avnet; Supplier Part Number 1: 311-1336-1-ND
D8 = BZT52C3V3-E3-08: Diode Zener Single 3.3V 6% 500mW 2-Pin SOD-123; Manufacturer: Vishay; Max Power Dissipation: 410mW; Impedance: 80R; Voltage Tolerance: 5%; Zener Current: 109mA; Max Reverse Leakage Current: 100nA; Test Current: 5mA; ESD Protection: Yes; Supplier 1: Newark; Manufacturer Part Number: BZT52C3V3-E3-08; RoHS: Yes; Category: Zener Diodes; Pricing 1: 1=0.28100, 10=0.19500, 25=0.16300, 50=0.13100, 100=0.09800, 250=0.09200, 500=0.08500, 1000=0.05700 (USD); Mount: Surface Mount; Number of Pins: 2; Contact Plating: Tin,Matte; Min Operating Temperature: -55°C; Max Operating Temperature: 150°C; Zener Voltage: 3.3V; Element Configuration: Single; Power Dissipation: 500mW; Packaging: Tape and Reel; Package Quantity: 3000; Tolerance: 5%; Radiation Hardening: No; ComponentLink1URL: https://datasheet.ciiva.com/24094/bzt52-106265-24094953.pdf?src-supplier=Mouser; ComponentLink1Description: https://datasheet.ciiva.com/24094/bzt52-106265-24094953.pdf?src-supplier=Mouser; Supplier Part Number 1: 06AC5888
R52 = WR06X1621FTL: RES 1.62K OHM 1% 1/10W 0603; Manufacturer: Walsin Technologies; Power Rating: 100mW; Resistance: 1.62kR; Supplier 1: Arrow Electronics; Manufacturer Part Number: WR06X1621FTL; RoHS: Yes; Category: Chip SMD Resistors; Stock 1: 145000; Pricing 1: 5000=0.00100 (USD); Case/Package: Molded; Contact Material: Tin; Lead Free: Lead Free; RoHS Compliant: Yes; Supplier Part Number 1: WR06X1621FTL
R53 = RT0603DRD071KL: RES SMD 1K OHM 0.5% 1/10W 0603; Manufacturer: Yageo; Resistance: 1kR; Temperature Coefficient: 25ppm/°C; Power Rating: 100mW; Voltage Rating: 75V; Voltage Rating (DC): 50V; Supplier 1: Digi-Key; Manufacturer Part Number: RT0603DRD071KL; Stock 1: 178947; Pricing 1: 1=0.2, 10=0.167, 100=0.0651, 1000=0.02725, 2500=0.02498 (USD); Case/Package: 0603; Contact Plating: Tin,Matte; Case Code (Metric): 1608; Case Code (Imperial): 0603; Min Operating Temperature: -55°C; Max Operating Temperature: 125°C; Tolerance: 0.5%; Composition: Thin Film; Packaging: Tape and Reel; Termination: SMD/SMT; Radiation Hardening: No; Lead Free: Lead Free; ComponentLink1URL: http://www.mouser.com/ds/2/447/yageodocoutput-1125656.pdf?src-supplier=Mouser; ComponentLink1Description: http://www.mouser.com/ds/2/447/yageodocoutput-1125656.pdf?src-supplier=Mouser; ComponentLink2URL: http://www.yageo.com/documents/recent/PYu-RT_1-to-0.05_RoHS_L_6.pdf?src-supplier=Avnet; ComponentLink2Description: http://www.yageo.com/documents/recent/PYu-RT_1-to-0.05_RoHS_L_6.pdf?src-supplier=Avnet; Supplier Part Number 1: 311-1.0KDDKR-ND
R54 R55 = RC0603JR-074K7L: RES SMD 4.7K OHM 5% 1/10W 0603; Manufacturer: Yageo; Resistance: 4.7kR; Temperature Coefficient: 100ppm/°C; Voltage Rating (DC): 50V; Power Rating: 100mW; Supplier 1: Digi-Key; Manufacturer Part Number: RC0603JR-074K7L; Stock 1: 19706643; Pricing 1: 1=0.1, 10=0.02, 100=0.0081, 1000=0.00362, 2500=0.00314 (USD); Case/Package: 0603; Number of Pins: 2; Case Code (Imperial): 0603; Case Code (Metric): 1608; Min Operating Temperature: -55°C; Max Operating Temperature: 155°C; Tolerance: 5%; Composition: Thick Film; Packaging: Tape and Reel; Voltage Rating: 50V; Termination: SMD/SMT; Military Standard: Not; Length: 1.6mm; Width: 0.8mm; Depth: 0.8mm; REACH SVHC: No SVHC; Lead Free: Lead Free; ComponentLink1URL: http://www.farnell.com/datasheets/443971.pdf?src-supplier=Element14; ComponentLink1Description: http://www.farnell.com/datasheets/443971.pdf?src-supplier=Element14; Supplier Part Number 1: 311-4.7KGRCT-ND
U10 = RK3399: as U10 on sheet Internal_Power_Sheet; ComponentLink1Description: Aliexpress; ComponentLink1URL: https://www.aliexpress.com/item/1005001971093459.html?spm=a2g0n.productlist.0.0.3c7csv8Qsv8Quh&browser_id=3ac7e9efb8074641aaabc4d871f09748&aff_trace_key=&aff_platform=msite&m_page_id=181389a08711fc2600d8cc522bab8d702dd4189be0&gclid=&pdp_npi=2%40dis%21USD%21%2123.6%21%21%21%21%21%402101d91e16545120399167831e8b89%21%21sea&algo_pvid=4303aedd-774c-4013-953d-920f10b55003; Manufacturer Part Number: RK3399; Footprint: FCBGA828

## Sheet eMMC_Sheet.SchDoc
size A4; DocumentNumber: 13; SheetNumber: 13; SheetTotal: 27
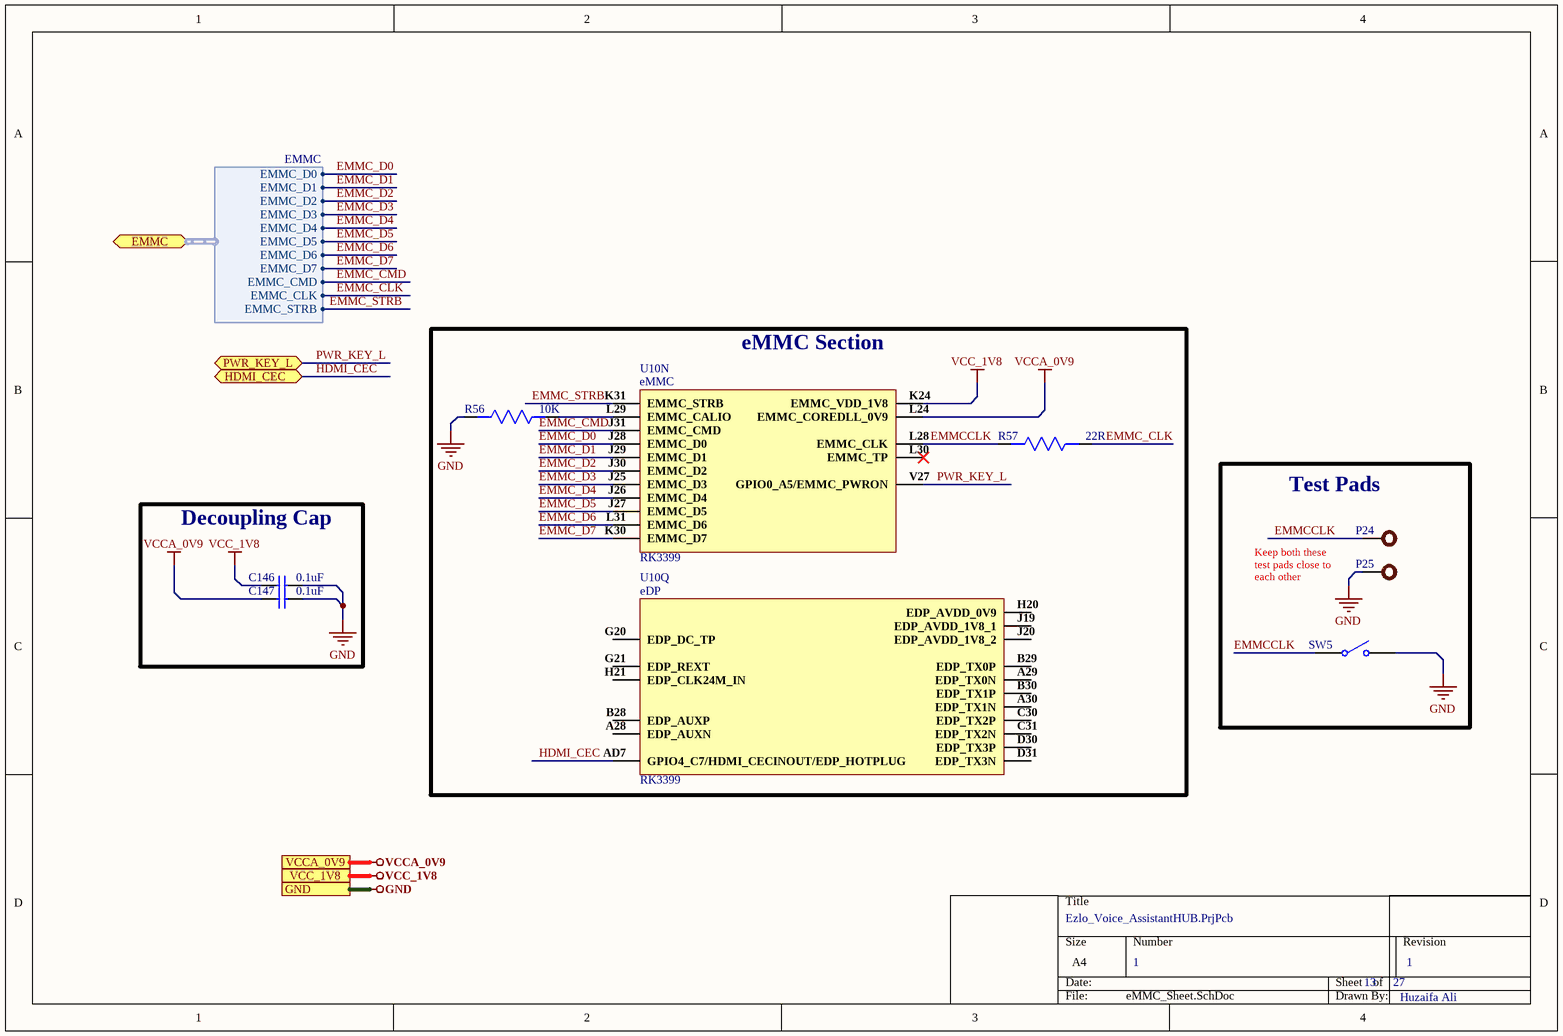
[diagram p12: eMMC_Sheet.SchDoc]

### Parts
C146  0.1uF  [Cap0402]
C147  0.1uF  [Cap0402]
P24  TEST POINT  [TEST POINT]  (value not drawn)
P25  TEST POINT  [TEST POINT]  (value not drawn)
R56  10K  [Res0603]
R57  22R  [Res0603]
SW5  TS-1185EC-C-D-B  [TS-1185EC-C-D-B]  (value not drawn)
U10  RK3399  [RK3399]  (parts N,Q of 34)

### Blocks framed on the sheet
eMMC Section: R56 R57 U10
Decoupling Cap: C146 C147
Test Pads: P24 P25 SW5

### Ports
EMMC (bidir, harness EMMC), GND, HDMI_CEC (bidir), PWR_KEY_L (bidir), VCC_1V8, VCCA_0V9

### Harnesses
EMMC: EMMC_D0, EMMC_D1, EMMC_D2, EMMC_D3, EMMC_D4, EMMC_D5, EMMC_D6, EMMC_D7, EMMC_CMD, EMMC_CLK, EMMC_STRB

### Nets
GND: C146.2 C147.2 P25.1 R56.2 SW5.2 ; port GND
VCC_1V8: C146.1 U10.K24(EMMC_VDD_1V8) ; port VCC_1V8
VCCA_0V9: C147.1 U10.L24(EMMC_COREDLL_0V9) ; port VCCA_0V9
EMMC_CLK: R57.1 ; port EMMC.EMMC_CLK  [project net EMMC.EMMC_CLK]
EMMC_CMD: U10.J31(EMMC_CMD) ; port EMMC.EMMC_CMD  [project net EMMC.EMMC_CMD]
EMMC_D0: U10.J28(EMMC_D0) ; port EMMC.EMMC_D0  [project net EMMC.EMMC_D0]
EMMC_D1: U10.J29(EMMC_D1) ; port EMMC.EMMC_D1  [project net EMMC.EMMC_D1]
EMMC_D2: U10.J30(EMMC_D2) ; port EMMC.EMMC_D2  [project net EMMC.EMMC_D2]
EMMC_D3: U10.J25(EMMC_D3) ; port EMMC.EMMC_D3  [project net EMMC.EMMC_D3]
EMMC_D4: U10.J26(EMMC_D4) ; port EMMC.EMMC_D4  [project net EMMC.EMMC_D4]
EMMC_D5: U10.J27(EMMC_D5) ; port EMMC.EMMC_D5  [project net EMMC.EMMC_D5]
EMMC_D6: U10.L31(EMMC_D6) ; port EMMC.EMMC_D6  [project net EMMC.EMMC_D6]
EMMC_D7: U10.K30(EMMC_D7) ; port EMMC.EMMC_D7  [project net EMMC.EMMC_D7]
EMMC_STRB: U10.K31(EMMC_STRB) ; port EMMC.EMMC_STRB  [project net EMMC.EMMC_STRB]
EMMCCLK: P24.1 R57.2 SW5.1 U10.L28(EMMC_CLK)
HDMI_CEC: U10.AD7(GPIO4_C7/HDMI_CECINOUT/EDP_HOTPLUG) ; port HDMI_CEC
PWR_KEY_L: U10.V27(GPIO0_A5/EMMC_PWRON) ; port PWR_KEY_L
NetR56_1: R56.1 U10.L29(EMMC_CALIO)

Not connected (* = marked no-connect by the designer): U10 A28(EDP_AUXN) A29(EDP_TX0N) A30(EDP_TX1N) B28(EDP_AUXP) B29(EDP_TX0P) B30(EDP_TX1P) C30(EDP_TX2P) C31(EDP_TX2N) D30(EDP_TX3P) D31(EDP_TX3N) G20(EDP_DC_TP) G21(EDP_REXT) H20(EDP_AVDD_0V9) H21(EDP_CLK24M_IN) J19(EDP_AVDD_1V8_1) J20(EDP_AVDD_1V8_2) L30(EMMC_TP)*

### Notes on the sheet
- Keep both these test pads close to each other
- 1
- Huzaifa Ali
- (in symbol RK3399, part N) eMMC
- (in symbol RK3399, part Q) eDP

### Library data of the parts
C146 C147 = CC0402KRX5R6BB104: as C68 on sheet Internal_Power_Sheet; Supplier 1: Digi-Key; Manufacturer Part Number: CC0402KRX5R6BB104; RoHS: Yes; Category: Ceramic Capacitors; Stock 1: 6385580; Pricing 1: 1=0.10000, 10=0.02700, 50=0.01500, 100=0.01220, 500=0.00874, 1000=0.00687, 2500=0.00625, 5000=0.00575 (USD); Mount: Surface Mount; Case/Package: 0402; Number of Pins: 2; Case Code (Imperial): 0402; Case Code (Metric): 1005; Min Operating Temperature: -55°C; Max Operating Temperature: 85°C; Dielectric: X5R; Packaging: Tape and Reel; Voltage Rating: 10V; Package Quantity: 1; Termination: SMD/SMT; Voltage Rating (DC): 10V; Series: CC; Length: 1mm; Width: 0.02inch; Height: 0.5mm; Depth: 0.5mm; Thickness: 0.022inch; Radiation Hardening: No; RoHS Compliant: Yes; REACH SVHC: No SVHC; Lead Free: Lead Free; Halogen Free: Halogen Free; ComponentLink1URL: https://datasheet.ciiva.com/144/mlccorderingcode-144029.pdf?src-supplier=Digi-Key; ComponentLink1Description: https://datasheet.ciiva.com/144/mlccorderingcode-144029.pdf?src-supplier=Digi-Key; ComponentLink2URL: https://datasheet.ciiva.com/144/mlccorderingcode-144028.pdf?src-supplier=Digi-Key; ComponentLink2Description: https://datasheet.ciiva.com/144/mlccorderingcode-144028.pdf?src-supplier=Digi-Key; ComponentLink3URL: https://datasheet.ciiva.com/144/mlccorderingcode-144030.pdf?src-supplier=Digi-Key; ComponentLink3Description: https://datasheet.ciiva.com/144/mlccorderingcode-144030.pdf?src-supplier=Digi-Key; ComponentLink4URL: https://datasheet.ciiva.com/7978/1359354-7978091.pdf?src-supplier=Element14; ComponentLink4Description: https://datasheet.ciiva.com/7978/1359354-7978091.pdf?src-supplier=Element14; ComponentLink5URL: https://datasheet.ciiva.com/11587/upy-gphc-x5r-4v-to-50v-12-11587302.pdf?src-supplier=Avnet; ComponentLink5Description: https://datasheet.ciiva.com/11587/upy-gphc-x5r-4v-to-50v-12-11587302.pdf?src-supplier=Avnet; Supplier Part Number 1: 311-1336-1-ND
P24 P25 = TEST POINT: Test Point ON
R56 = AC0603JR-0710KL: RES SMD 10K OHM 5% 1/10W 0603; Manufacturer: Yageo; Voltage Rating: 50V; Resistance: 10kR; Power Rating: 100mW; Temperature Coefficient: 100ppm/°C; Supplier 1: Future Electronics; Manufacturer Part Number: AC0603JR-0710KL; RoHS: Yes; Category: Chip SMD Resistors; Stock 1: 1533000; Pricing 1: 5000=0.00540 (USD); Case/Package: 0603; Case Code (Imperial): 0603; Case Code (Metric): 1608; Size Code: 0603; Min Operating Temperature: -55°C; Max Operating Temperature: 155°C; Packaging: Tape and Reel; Tolerance: 5%; Package Quantity: 1; Resistor Type: Thick Film; Termination: SMD/SMT; Number of Terminations: 2; Max Power Dissipation: 100mW; Features: Moisture Resistant,Automotive AEC-Q200,Anti-Sulfur; Series: AC; Construction: Rectangular; Length: 0.063inch; Width: 0.031inch; Height: 0.022inch; Depth: 0.8mm; Military Standard: Not; Lead Free: Lead Free; RoHS Compliant: Yes; ComponentLink1URL: https://datasheet.ciiva.com/5562/pyu-ac-51-rohs-l-2-5562553.pdf?src-supplier=Mouser; ComponentLink1Description: https://datasheet.ciiva.com/5562/pyu-ac-51-rohs-l-2-5562553.pdf?src-supplier=Mouser; Supplier Part Number 1: 1029044
R57 = CRCW060322R0JNEAHP: RES SMD 22 OHM 5% 1/3W 0603; Manufacturer: Vishay Dale; Temperature Coefficient: 200ppm/°C; Power Rating: 250mW; Voltage Rating: 75V; Supplier 1: Digi-Key; Manufacturer Part Number: CRCW060322R0JNEAHP; Stock 1: 245392; Pricing 1: 1=0.15, 10=0.129, 100=0.0506, 1000=0.02119, 2500=0.01942 (USD); Mount: Surface Mount; Case/Package: 0603; Weight: 7.1E-05oz; Contact Plating: Tin; Case Code (Imperial): 0603; Case Code (Metric): 1608; Min Operating Temperature: -55°C; Max Operating Temperature: 155°C; Resistance: 22R; Tolerance: 5%; Composition: Thick Film; Packaging: Tape and Reel; Package Quantity: 5000; Military Standard: Not; Length: 1.6mm; Height: 0.45mm; Width: 0.8mm; Depth: 0.85mm; Radiation Hardening: No; Lead Free: Lead Free; ComponentLink1URL: http://www.vishay.com/docs/20043/crcwhpe3.pdf?src-supplier=Avnet+Europe; ComponentLink1Description: http://www.vishay.com/docs/20043/crcwhpe3.pdf?src-supplier=Avnet+Europe; ComponentLink2URL: http://www.mouser.com/ds/2/427/dcrcwe3-109170.pdf?src-supplier=Mouser; ComponentLink2Description: http://www.mouser.com/ds/2/427/dcrcwe3-109170.pdf?src-supplier=Mouser; Supplier Part Number 1: 541-22SACT-ND
SW5 = TS-1185EC-C-D-B: as SW1-SW4 on sheet Power_Sheet_2; Manufacturer Part Number: TS-1185EC-C-D-B; Footprint: Custom; ComponentLink1Description: LCSC; ComponentLink1URL: https://lcsc.com/product-detail/Tactile-Switches_XKB-Connectivity-TS-1185EC-C-D-B_C318893.html
U10 = RK3399: as U10 on sheet Internal_Power_Sheet; ComponentLink1Description: Aliexpress; ComponentLink1URL: https://www.aliexpress.com/item/1005001971093459.html?spm=a2g0n.productlist.0.0.3c7csv8Qsv8Quh&browser_id=3ac7e9efb8074641aaabc4d871f09748&aff_trace_key=&aff_platform=msite&m_page_id=181389a08711fc2600d8cc522bab8d702dd4189be0&gclid=&pdp_npi=2%40dis%21USD%21%2123.6%21%21%21%21%21%402101d91e16545120399167831e8b89%21%21sea&algo_pvid=4303aedd-774c-4013-953d-920f10b55003; Manufacturer Part Number: RK3399; Footprint: FCBGA828

## Sheet MIPI_Sheet.SchDoc
size A4; DocumentNumber: 15; SheetNumber: 15; SheetTotal: 27
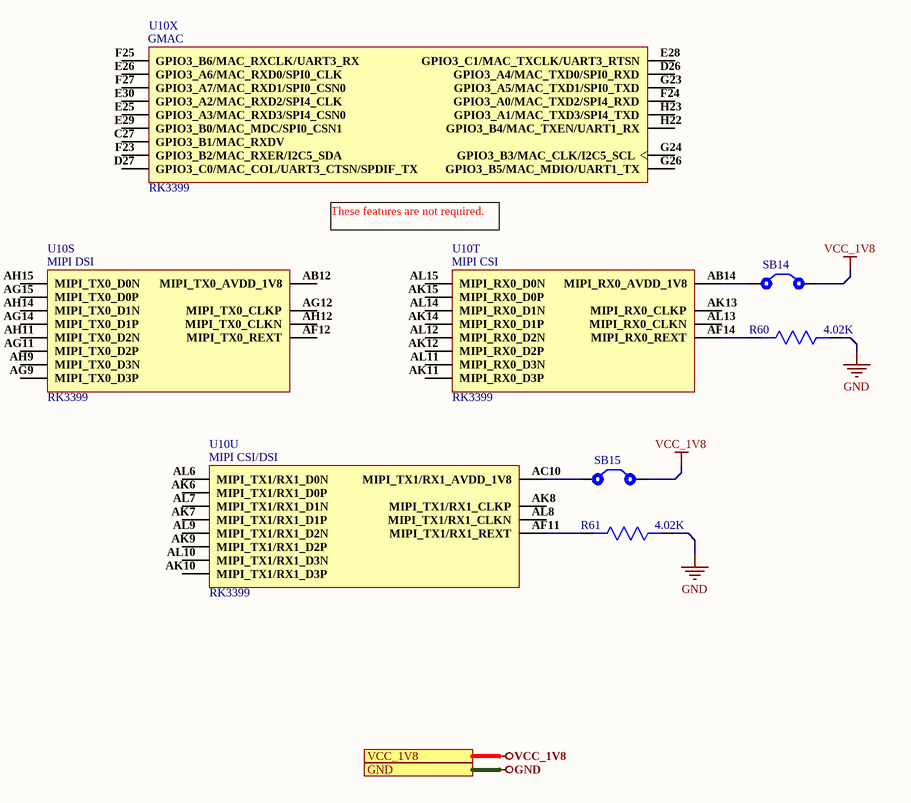
[diagram p13: MIPI_Sheet.SchDoc]

### Parts
R60  4.02K  [Res0603]
R61  4.02K  [Res0603]
SB14  Solder Bridge  [Solder Bridge]  (value not drawn)
SB15  Solder Bridge  [Solder Bridge]  (value not drawn)
U10  RK3399  [RK3399]  (parts S,T,U,X of 34)

### Ports
GND, VCC_1V8

### Nets
GND: R60.1 R61.1 ; port GND
VCC_1V8: SB14.2 SB15.2 ; port VCC_1V8
NetR60_2: R60.2 U10.AF14(MIPI_RX0_REXT)
NetR61_2: R61.2 U10.AF11(MIPI_TX1/RX1_REXT)
NetSB14_1: SB14.1 U10.AB14(MIPI_RX0_AVDD_1V8)
NetSB15_1: SB15.1 U10.AC10(MIPI_TX1/RX1_AVDD_1V8)

Not connected (* = marked no-connect by the designer): U10 AB12(MIPI_TX0_AVDD_1V8) AF12(MIPI_TX0_REXT) AG9(MIPI_TX0_D3P) AG11(MIPI_TX0_D2P) AG12(MIPI_TX0_CLKP) AG14(MIPI_TX0_D1P) AG15(MIPI_TX0_D0P) AH9(MIPI_TX0_D3N) AH11(MIPI_TX0_D2N) AH12(MIPI_TX0_CLKN) AH14(MIPI_TX0_D1N) AH15(MIPI_TX0_D0N) AK6(MIPI_TX1/RX1_D0P) AK7(MIPI_TX1/RX1_D1P) AK8(MIPI_TX1/RX1_CLKP) AK9(MIPI_TX1/RX1_D2P) AK10(MIPI_TX1/RX1_D3P) AK11(MIPI_RX0_D3P) AK12(MIPI_RX0_D2P) AK13(MIPI_RX0_CLKP) AK14(MIPI_RX0_D1P) AK15(MIPI_RX0_D0P) AL6(MIPI_TX1/RX1_D0N) AL7(MIPI_TX1/RX1_D1N) AL8(MIPI_TX1/RX1_CLKN) AL9(MIPI_TX1/RX1_D2N) AL10(MIPI_TX1/RX1_D3N) AL11(MIPI_RX0_D3N) AL12(MIPI_RX0_D2N) AL13(MIPI_RX0_CLKN) AL14(MIPI_RX0_D1N) AL15(MIPI_RX0_D0N) C27(GPIO3_B1/MAC_RXDV) D26(GPIO3_A4/MAC_TXD0/SPI0_RXD) D27(GPIO3_C0/MAC_COL/UART3_CTSN/SPDIF_TX) E25(GPIO3_A3/MAC_RXD3/SPI4_CSN0) E26(GPIO3_A6/MAC_RXD0/SPI0_CLK) E28(GPIO3_C1/MAC_TXCLK/UART3_RTSN) E29(GPIO3_B0/MAC_MDC/SPI0_CSN1) E30(GPIO3_A2/MAC_RXD2/SPI4_CLK) F23(GPIO3_B2/MAC_RXER/I2C5_SDA) F24(GPIO3_A0/MAC_TXD2/SPI4_RXD) F25(GPIO3_B6/MAC_RXCLK/UART3_RX) F27(GPIO3_A7/MAC_RXD1/SPI0_CSN0) G23(GPIO3_A5/MAC_TXD1/SPI0_TXD) G24(GPIO3_B3/MAC_CLK/I2C5_SCL) G26(GPIO3_B5/MAC_MDIO/UART1_TX) H22(GPIO3_B4/MAC_TXEN/UART1_RX) H23(GPIO3_A1/MAC_TXD3/SPI4_TXD)

### Notes on the sheet
- (near U10) These features are not required.
- 1
- Huzaifa Ali
- (in symbol RK3399, part S) MIPI DSI
- (in symbol RK3399, part T) MIPI CSI
- (in symbol RK3399, part U) MIPI CSI/DSI
- (in symbol RK3399, part X) GMAC

### Library data of the parts
R60 R61 = 0603WAF4021T5E: 4.02kΩ 0603 Chip Resistor - Surface Mount ROHS; Manufcaturer: UNI-ROYAL; Manufcaturer Part Number: 0603WAF4021T5E; Footprint: 0603; ComponentLink1Description: LCSC; ComponentLink1URL: https://www.lcsc.com/product-detail/Chip-span-style-background-color-ff0-Resistor-span-Surface-Mount_UNI-ROYAL-Uniroyal-Elec-0603WAF4021T5E_C23040.html
SB14 SB15 = Solder Bridge: Solder Bridge ON
U10 = RK3399: as U10 on sheet Internal_Power_Sheet; ComponentLink1Description: Aliexpress; ComponentLink1URL: https://www.aliexpress.com/item/1005001971093459.html?spm=a2g0n.productlist.0.0.3c7csv8Qsv8Quh&browser_id=3ac7e9efb8074641aaabc4d871f09748&aff_trace_key=&aff_platform=msite&m_page_id=181389a08711fc2600d8cc522bab8d702dd4189be0&gclid=&pdp_npi=2%40dis%21USD%21%2123.6%21%21%21%21%21%402101d91e16545120399167831e8b89%21%21sea&algo_pvid=4303aedd-774c-4013-953d-920f10b55003; Manufacturer Part Number: RK3399; Footprint: FCBGA828

## Sheet PCIe_Sheet.SchDoc
size A4; DocumentNumber: 17; SheetNumber: 17; SheetTotal: 27
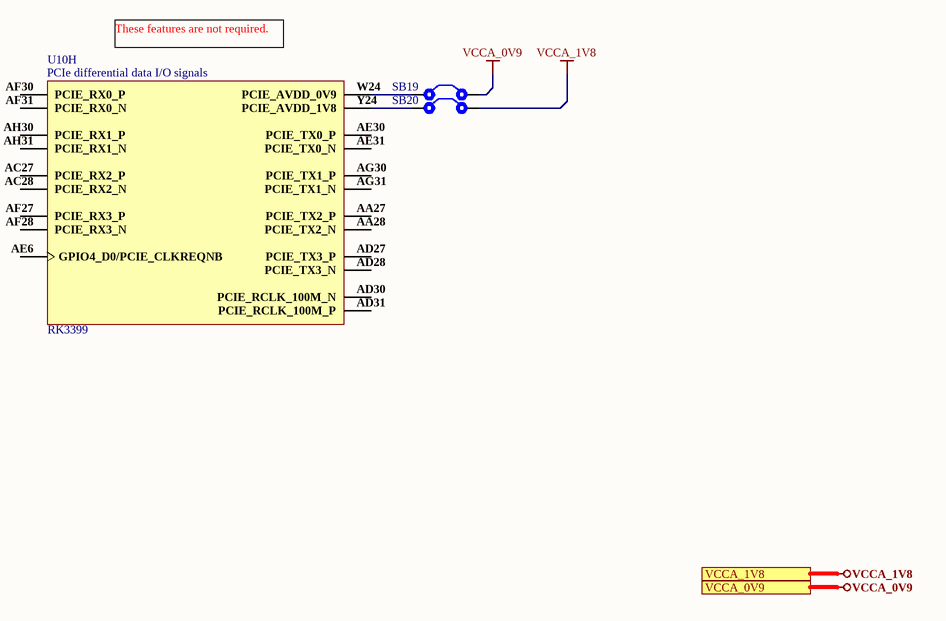
[diagram p14: PCIe_Sheet.SchDoc]

### Parts
SB19  Solder Bridge  [Solder Bridge]  (value not drawn)
SB20  Solder Bridge  [Solder Bridge]  (value not drawn)
U10  RK3399  [RK3399]  (part H of 34)

### Ports
VCCA_0V9, VCCA_1V8

### Nets
VCCA_0V9: SB19.2 ; port VCCA_0V9
VCCA_1V8: SB20.2 ; port VCCA_1V8
NetSB19_1: SB19.1 U10.W24(PCIE_AVDD_0V9)
NetSB20_1: SB20.1 U10.Y24(PCIE_AVDD_1V8)

Not connected (* = marked no-connect by the designer): U10 AA27(PCIE_TX2_P) AA28(PCIE_TX2_N) AC27(PCIE_RX2_P) AC28(PCIE_RX2_N) AD27(PCIE_TX3_P) AD28(PCIE_TX3_N) AD30(PCIE_RCLK_100M_N) AD31(PCIE_RCLK_100M_P) AE6(GPIO4_D0/PCIE_CLKREQNB) AE30(PCIE_TX0_P) AE31(PCIE_TX0_N) AF27(PCIE_RX3_P) AF28(PCIE_RX3_N) AF30(PCIE_RX0_P) AF31(PCIE_RX0_N) AG30(PCIE_TX1_P) AG31(PCIE_TX1_N) AH30(PCIE_RX1_P) AH31(PCIE_RX1_N)

### Notes on the sheet
- (near U10) These features are not required.
- 1
- Huzaifa Ali
- (in symbol RK3399, part H) PCIe differential data I/O signals

### Library data of the parts
SB19 SB20 = Solder Bridge: Solder Bridge ON
U10 = RK3399: as U10 on sheet Internal_Power_Sheet; ComponentLink1Description: Aliexpress; ComponentLink1URL: https://www.aliexpress.com/item/1005001971093459.html?spm=a2g0n.productlist.0.0.3c7csv8Qsv8Quh&browser_id=3ac7e9efb8074641aaabc4d871f09748&aff_trace_key=&aff_platform=msite&m_page_id=181389a08711fc2600d8cc522bab8d702dd4189be0&gclid=&pdp_npi=2%40dis%21USD%21%2123.6%21%21%21%21%21%402101d91e16545120399167831e8b89%21%21sea&algo_pvid=4303aedd-774c-4013-953d-920f10b55003; Manufacturer Part Number: RK3399; Footprint: FCBGA828